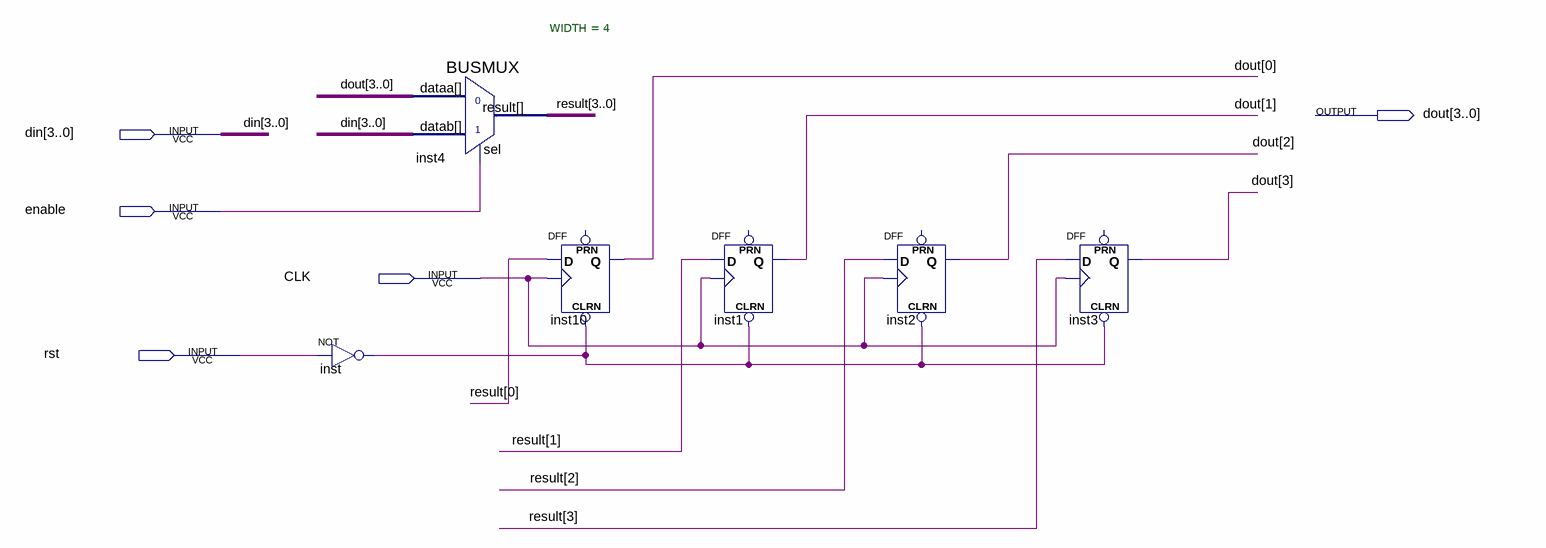
[diagram p0: schematic sheet]
// Quartus schematic registra_a_dor.bdf as structural Verilog: 6 symbols, 5 pins
module registra_a_dor (
  input  [3:0] din,
  input  enable,
  input  CLK,
  input  rst,
  output [3:0] dout
);

  wire inst_out;
  wire [3:0] result;

  not inst (inst_out, rst);
  BUSMUX #(.WIDTH(4)) inst4 (.datab(din), .sel(enable), .dataa(dout), .result(result));
  DFF inst10 (.CLRN(inst_out), .CLK(CLK), .D(result[0]), .Q(dout[0]));  // open: PRN
  DFF inst1 (.CLRN(inst_out), .CLK(CLK), .D(result[1]), .Q(dout[1]));  // open: PRN
  DFF inst2 (.CLRN(inst_out), .CLK(CLK), .D(result[2]), .Q(dout[2]));  // open: PRN
  DFF inst3 (.CLRN(inst_out), .CLK(CLK), .D(result[3]), .Q(dout[3]));  // open: PRN
endmodule
